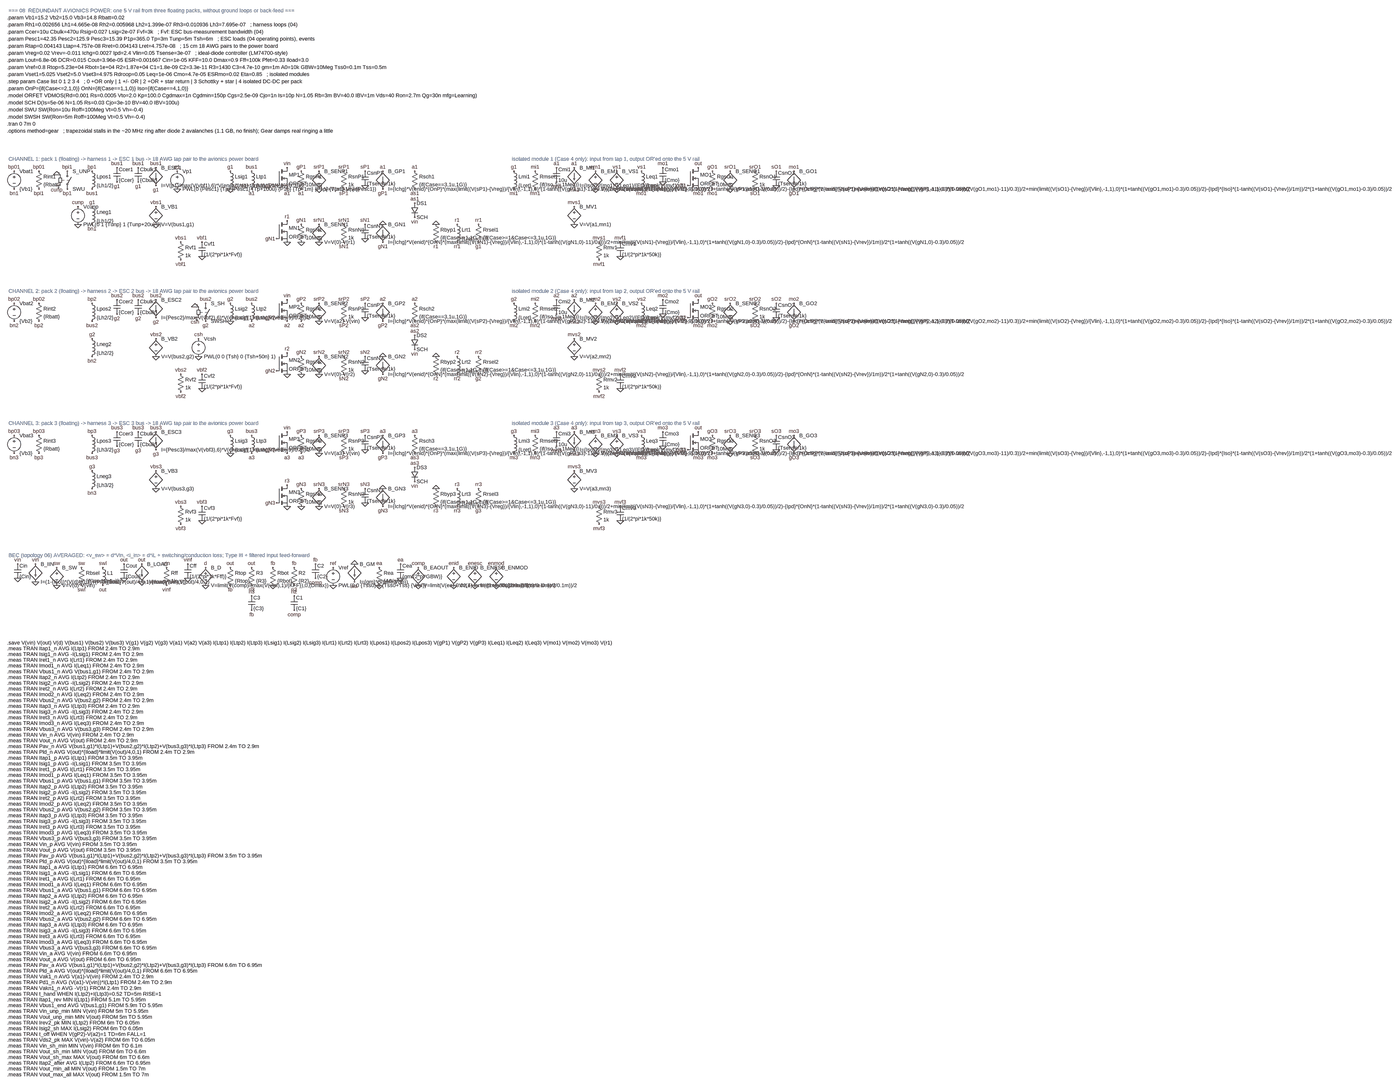
[diagram p0: schematic Redundant_Avionics.asc, whole sheet]
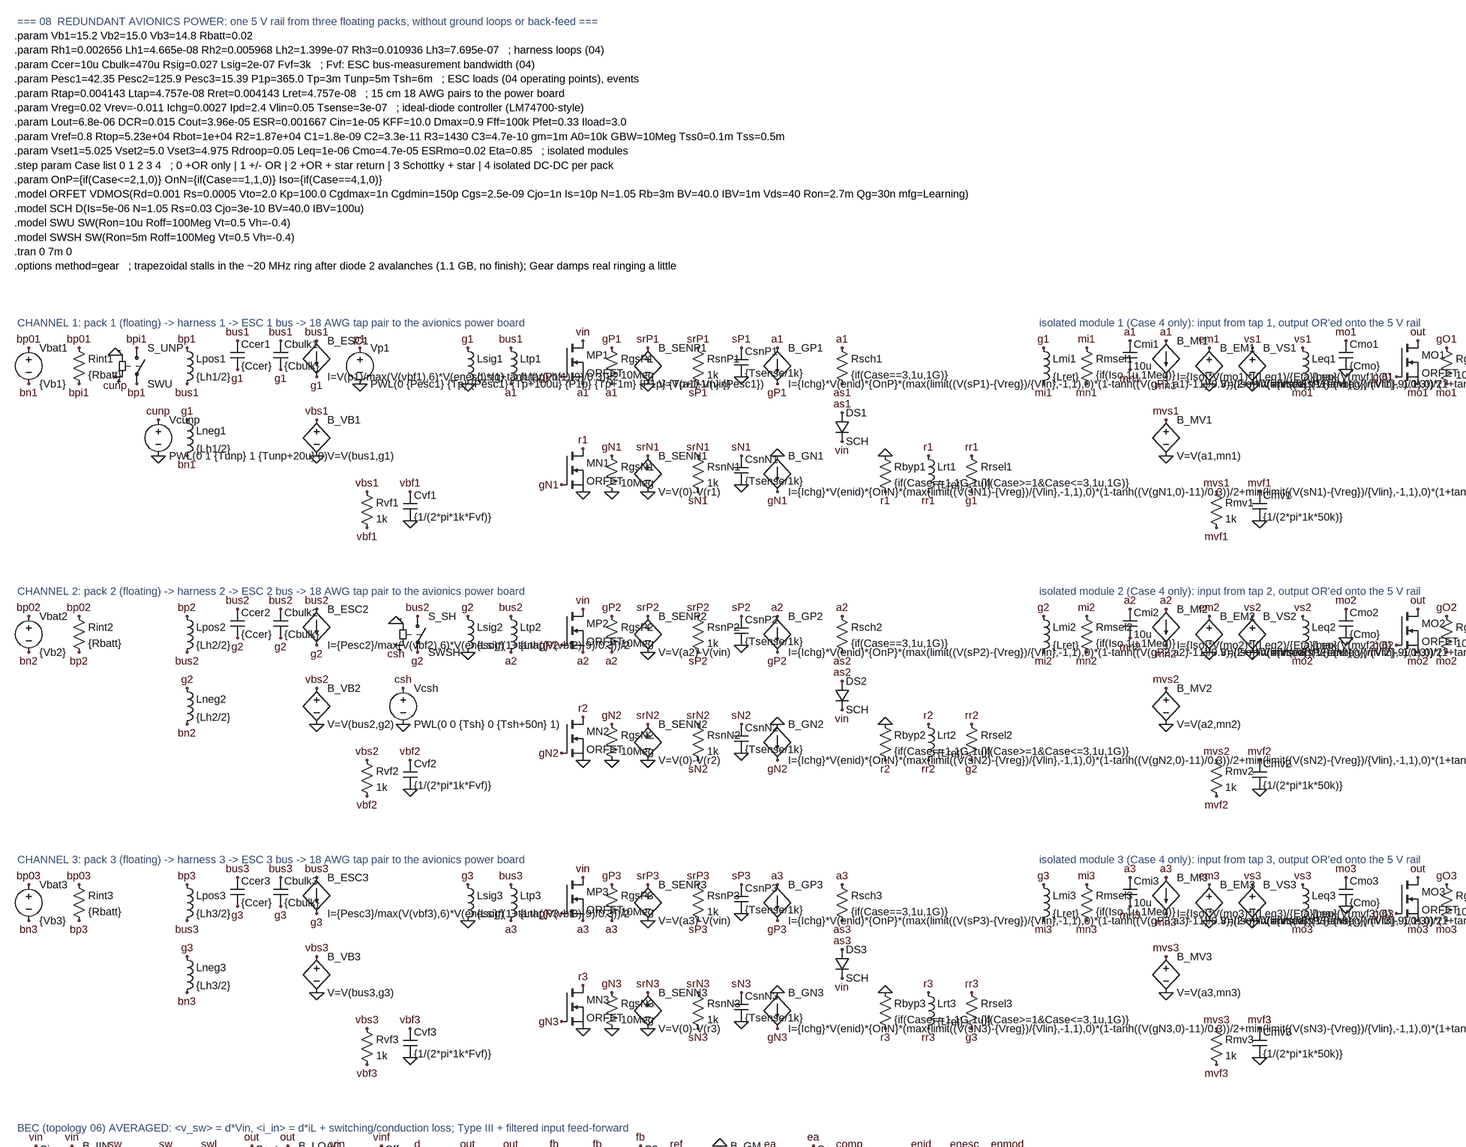
[diagram p1: schematic Redundant_Avionics.asc, part, row 1 of 2, column 1 of 2]
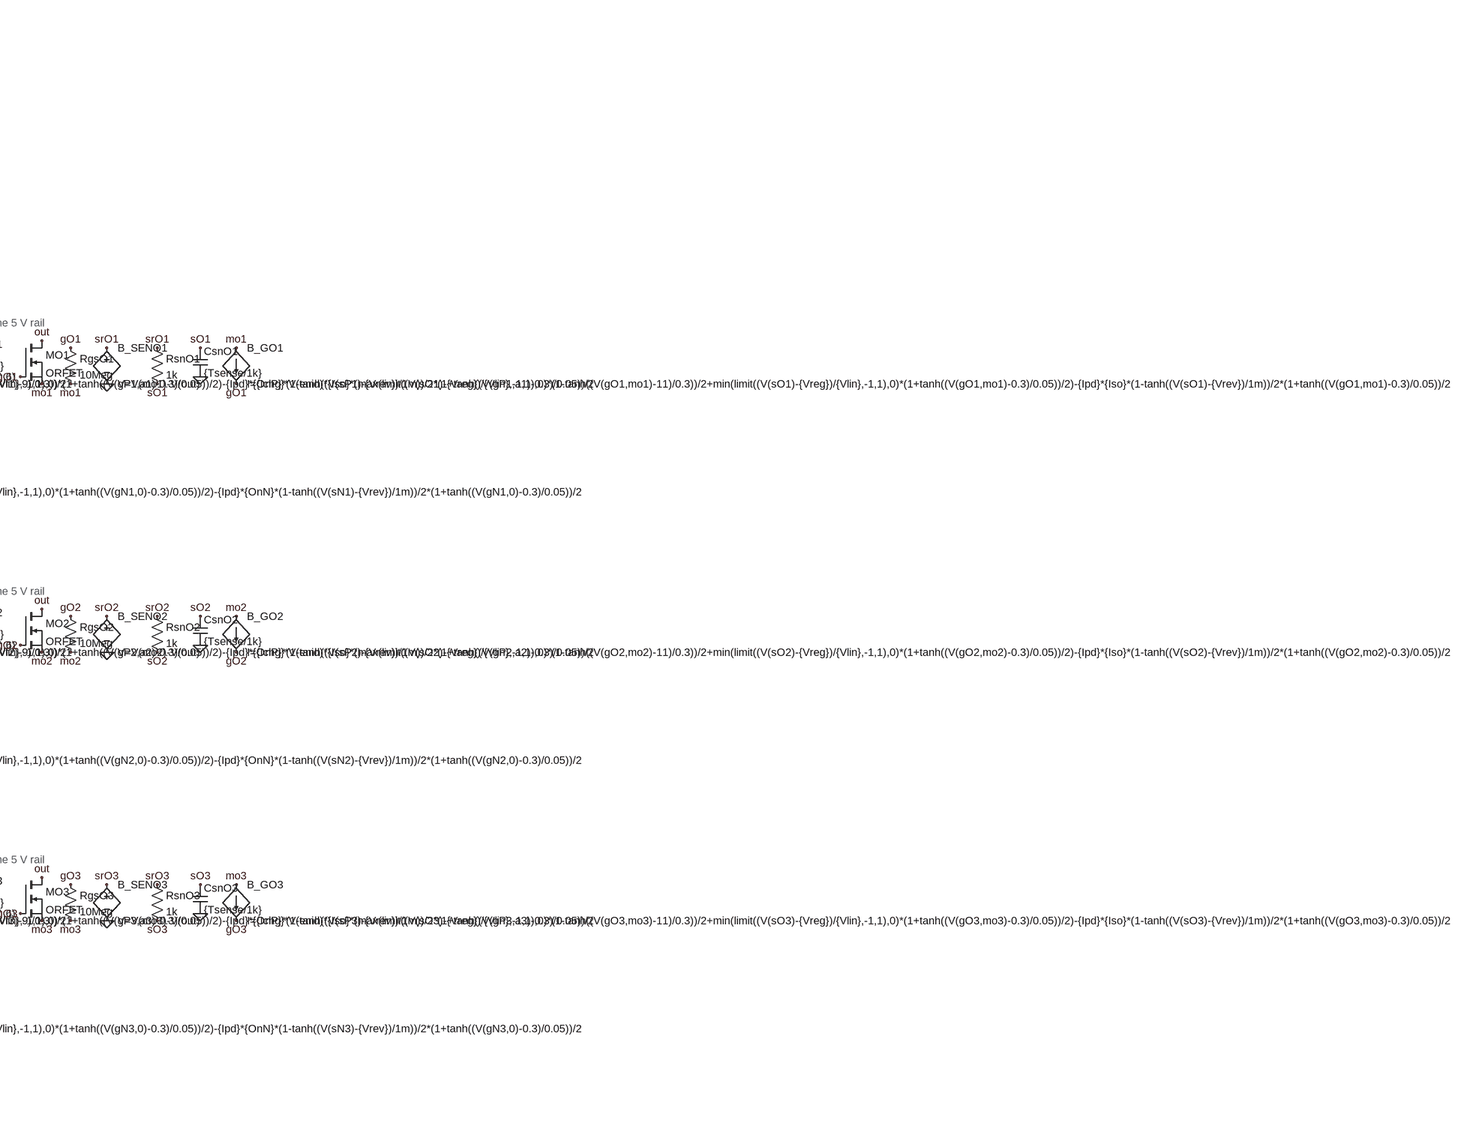
[diagram p2: schematic Redundant_Avionics.asc, part, row 1 of 2, column 2 of 2]
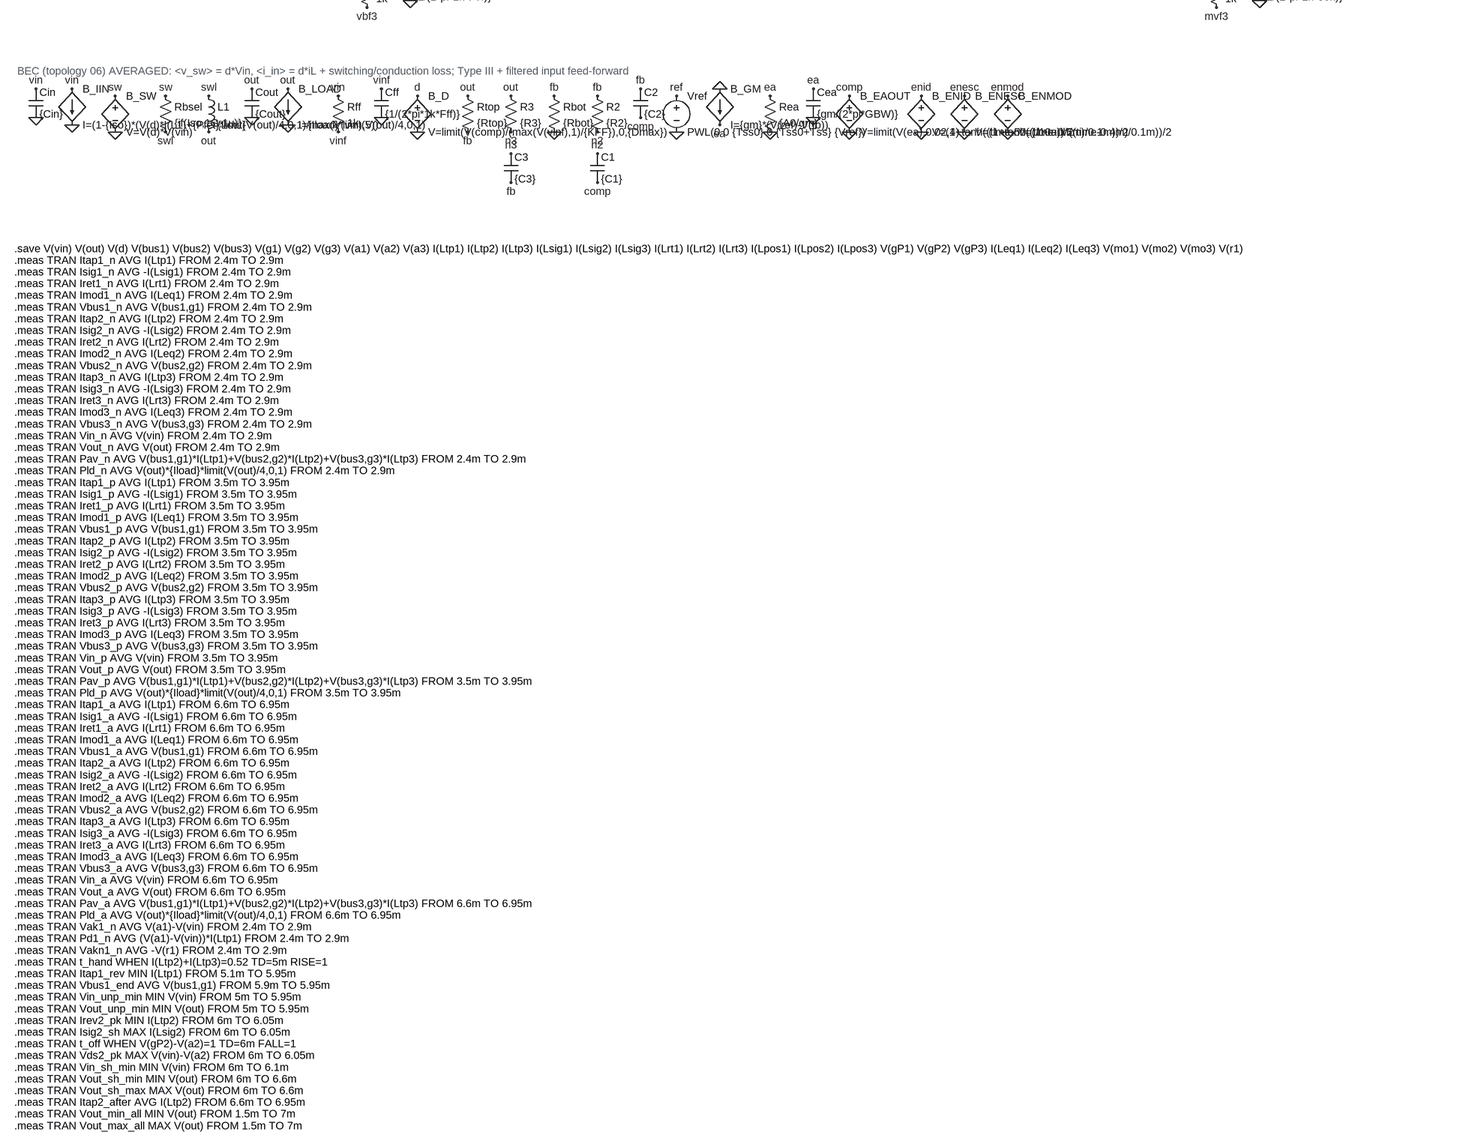
[diagram p3: schematic Redundant_Avionics.asc, part, row 2 of 2, column 1 of 2]
Redundant_Avionics.asc, the LTspice schematic file:
Version 4
SHEET 1 4200 3000
TEXT 32 -40 Left 2 ; CHANNEL 1: pack 1 (floating) -> harness 1 -> ESC 1 bus -> 18 AWG tap pair to the avionics power board
SYMBOL voltage 64 0 R0
SYMATTR InstName Vbat1
SYMATTR Value {Vb1}
FLAG 64 16 bp01
FLAG 64 96 bn1
SYMBOL res 160 0 R0
SYMATTR InstName Rint1
SYMATTR Value {Rbatt}
FLAG 176 16 bp01
FLAG 176 96 bpi1
SYMBOL sw 304 0 R0
SYMATTR InstName S_UNP
SYMATTR Value SWU
FLAG 304 16 bpi1
FLAG 304 96 bp1
FLAG 256 80 cunp
FLAG 256 32 0
SYMBOL voltage 352 160 R0
SYMATTR InstName Vcunp
SYMATTR Value PWL(0 1 {Tunp} 1 {Tunp+20u} 0)
FLAG 352 176 cunp
FLAG 352 256 0
SYMBOL ind 400 0 R0
SYMATTR InstName Lpos1
SYMATTR Value {Lh1/2}
SYMATTR SpiceLine Rser={Rh1/2}
FLAG 416 16 bp1
FLAG 416 96 bus1
SYMBOL ind 400 160 R0
SYMATTR InstName Lneg1
SYMATTR Value {Lh1/2}
SYMATTR SpiceLine Rser={Rh1/2}
FLAG 416 176 g1
FLAG 416 256 bn1
SYMBOL cap 512 0 R0
SYMATTR InstName Ccer1
SYMATTR Value {Ccer}
SYMATTR SpiceLine Rser=2m Lser=2n
FLAG 528 0 bus1
FLAG 528 64 g1
SYMBOL cap 608 0 R0
SYMATTR InstName Cbulk1
SYMATTR Value {Cbulk}
SYMATTR SpiceLine Rser=30m Lser=10n
FLAG 624 0 bus1
FLAG 624 64 g1
SYMBOL bi 704 0 R0
SYMATTR InstName B_ESC1
SYMATTR Value I=V(p1)/max(V(vbf1),6)*V(enesc)*(1+tanh((V(vbf1)-9)/0.3))/2
FLAG 704 0 bus1
FLAG 704 80 g1
SYMBOL bv 704 160 R0
SYMATTR InstName B_VB1
SYMATTR Value V=V(bus1,g1)
FLAG 704 176 vbs1
FLAG 704 256 0
SYMBOL res 800 320 R0
SYMATTR InstName Rvf1
SYMATTR Value 1k
FLAG 816 336 vbs1
FLAG 816 416 vbf1
SYMBOL cap 896 336 R0
SYMATTR InstName Cvf1
SYMATTR Value {1/(2*pi*1k*Fvf)}
FLAG 912 336 vbf1
FLAG 912 400 0
SYMBOL voltage 800 0 R0
SYMATTR InstName Vp1
SYMATTR Value PWL(0 {Pesc1} {Tp} {Pesc1} {Tp+100u} {P1p} {Tp+1m} {P1p} {Tp+1.1m} {Pesc1})
FLAG 800 16 p1
FLAG 800 96 0
SYMBOL ind 1024 0 R0
SYMATTR InstName Lsig1
SYMATTR Value {Lsig}
SYMATTR SpiceLine Rser={Rsig}
FLAG 1040 16 g1
FLAG 1040 96 0
SYMBOL ind 1120 0 R0
SYMATTR InstName Ltp1
SYMATTR Value {Ltap}
SYMATTR SpiceLine Rser={Rtap}
FLAG 1136 16 bus1
FLAG 1136 96 a1
SYMBOL nmos 1248 0 R0
SYMATTR InstName MP1
SYMATTR Value ORFET
FLAG 1296 0 vin
FLAG 1248 80 gP1
FLAG 1296 96 a1
SYMBOL res 1344 0 R0
SYMATTR InstName RgsP1
SYMATTR Value 10Meg
FLAG 1360 16 gP1
FLAG 1360 96 a1
SYMBOL bv 1440 0 R0
SYMATTR InstName B_SENP1
SYMATTR Value V=V(a1)-V(vin)
FLAG 1440 16 srP1
FLAG 1440 96 0
SYMBOL res 1536 0 R0
SYMATTR InstName RsnP1
SYMATTR Value 1k
FLAG 1552 16 srP1
FLAG 1552 96 sP1
SYMBOL cap 1632 16 R0
SYMATTR InstName CsnP1
SYMATTR Value {Tsense/1k}
FLAG 1648 16 sP1
FLAG 1648 80 0
SYMBOL bi 1728 16 R0
SYMATTR InstName B_GP1
SYMATTR Value I={Ichg}*V(enid)*{OnP}*(max(limit((V(sP1)-{Vreg})/{Vlin},-1,1),0)*(1-tanh((V(gP1,a1)-11)/0.3))/2+min(limit((V(sP1)-{Vreg})/{Vlin},-1,1),0)*(1+tanh((V(gP1,a1)-0.3)/0.05))/2)-{Ipd}*{OnP}*(1-tanh((V(sP1)-{Vrev})/1m))/2*(1+tanh((V(gP1,a1)-0.3)/0.05))/2
FLAG 1728 16 a1
FLAG 1728 96 gP1
SYMBOL res 1856 0 R0
SYMATTR InstName Rsch1
SYMATTR Value {if(Case==3,1u,1G)}
FLAG 1872 16 a1
FLAG 1872 96 as1
SYMBOL diode 1856 160 R0
SYMATTR InstName DS1
SYMATTR Value SCH
FLAG 1872 160 as1
FLAG 1872 224 vin
SYMBOL nmos 1248 240 R0
SYMATTR InstName MN1
SYMATTR Value ORFET
FLAG 1296 240 r1
FLAG 1248 320 gN1
FLAG 1296 336 0
SYMBOL res 1344 240 R0
SYMATTR InstName RgsN1
SYMATTR Value 10Meg
FLAG 1360 256 gN1
FLAG 1360 336 0
SYMBOL bv 1440 240 R0
SYMATTR InstName B_SENN1
SYMATTR Value V=V(0)-V(r1)
FLAG 1440 256 srN1
FLAG 1440 336 0
SYMBOL res 1536 240 R0
SYMATTR InstName RsnN1
SYMATTR Value 1k
FLAG 1552 256 srN1
FLAG 1552 336 sN1
SYMBOL cap 1632 256 R0
SYMATTR InstName CsnN1
SYMATTR Value {Tsense/1k}
FLAG 1648 256 sN1
FLAG 1648 320 0
SYMBOL bi 1728 256 R0
SYMATTR InstName B_GN1
SYMATTR Value I={Ichg}*V(enid)*{OnN}*(max(limit((V(sN1)-{Vreg})/{Vlin},-1,1),0)*(1-tanh((V(gN1,0)-11)/0.3))/2+min(limit((V(sN1)-{Vreg})/{Vlin},-1,1),0)*(1+tanh((V(gN1,0)-0.3)/0.05))/2)-{Ipd}*{OnN}*(1-tanh((V(sN1)-{Vrev})/1m))/2*(1+tanh((V(gN1,0)-0.3)/0.05))/2
FLAG 1728 256 0
FLAG 1728 336 gN1
SYMBOL res 1952 240 R0
SYMATTR InstName Rbyp1
SYMATTR Value {if(Case==1,1G,1u)}
FLAG 1968 256 0
FLAG 1968 336 r1
SYMBOL ind 2048 240 R0
SYMATTR InstName Lrt1
SYMATTR Value {Lret}
SYMATTR SpiceLine Rser={Rret}
FLAG 2064 256 r1
FLAG 2064 336 rr1
SYMBOL res 2144 240 R0
SYMATTR InstName Rrsel1
SYMATTR Value {if(Case>=1&Case<=3,1u,1G)}
FLAG 2160 256 rr1
FLAG 2160 336 g1
TEXT 2304 -40 Left 2 ; isolated module 1 (Case 4 only): input from tap 1, output OR'ed onto the 5 V rail
SYMBOL ind 2304 0 R0
SYMATTR InstName Lmi1
SYMATTR Value {Lret}
SYMATTR SpiceLine Rser={Rret}
FLAG 2320 16 g1
FLAG 2320 96 mi1
SYMBOL res 2400 0 R0
SYMATTR InstName Rmsel1
SYMATTR Value {if(Iso,1u,1Meg)}
FLAG 2416 16 mi1
FLAG 2416 96 mn1
SYMBOL cap 2496 0 R0
SYMATTR InstName Cmi1
SYMATTR Value 10u
SYMATTR SpiceLine Rser=5m
FLAG 2512 0 a1
FLAG 2512 64 mn1
SYMBOL bi 2592 0 R0
SYMATTR InstName B_MI1
SYMATTR Value I={Iso}*V(mo1)*I(Leq1)/{Eta}/max(V(mvf1),6)
FLAG 2592 0 a1
FLAG 2592 80 mn1
SYMBOL bv 2592 160 R0
SYMATTR InstName B_MV1
SYMATTR Value V=V(a1,mn1)
FLAG 2592 176 mvs1
FLAG 2592 256 0
SYMBOL res 2688 320 R0
SYMATTR InstName Rmv1
SYMATTR Value 1k
FLAG 2704 336 mvs1
FLAG 2704 416 mvf1
SYMBOL cap 2784 336 R0
SYMATTR InstName Cmv1
SYMATTR Value {1/(2*pi*1k*50k)}
FLAG 2800 336 mvf1
FLAG 2800 400 0
SYMBOL bv 2688 0 R0
SYMATTR InstName B_EM1
SYMATTR Value V={Iso}*V(enmod)*(1+tanh((V(mvf1)-9)/0.3))/2
FLAG 2688 16 em1
FLAG 2688 96 0
SYMBOL bv 2784 0 R0
SYMATTR InstName B_VS1
SYMATTR Value V={Vset1}*V(em1)
FLAG 2784 16 vs1
FLAG 2784 96 0
SYMBOL ind 2880 0 R0
SYMATTR InstName Leq1
SYMATTR Value {Leq}
SYMATTR SpiceLine Rser={Rdroop}
FLAG 2896 16 vs1
FLAG 2896 96 mo1
SYMBOL cap 2976 0 R0
SYMATTR InstName Cmo1
SYMATTR Value {Cmo}
SYMATTR SpiceLine Rser={ESRmo}
FLAG 2992 0 mo1
FLAG 2992 64 0
SYMBOL nmos 3104 0 R0
SYMATTR InstName MO1
SYMATTR Value ORFET
FLAG 3152 0 out
FLAG 3104 80 gO1
FLAG 3152 96 mo1
SYMBOL res 3200 0 R0
SYMATTR InstName RgsO1
SYMATTR Value 10Meg
FLAG 3216 16 gO1
FLAG 3216 96 mo1
SYMBOL bv 3296 0 R0
SYMATTR InstName B_SENO1
SYMATTR Value V=V(mo1)-V(out)
FLAG 3296 16 srO1
FLAG 3296 96 0
SYMBOL res 3392 0 R0
SYMATTR InstName RsnO1
SYMATTR Value 1k
FLAG 3408 16 srO1
FLAG 3408 96 sO1
SYMBOL cap 3488 16 R0
SYMATTR InstName CsnO1
SYMATTR Value {Tsense/1k}
FLAG 3504 16 sO1
FLAG 3504 80 0
SYMBOL bi 3584 16 R0
SYMATTR InstName B_GO1
SYMATTR Value I={Ichg}*V(enid)*{Iso}*(max(limit((V(sO1)-{Vreg})/{Vlin},-1,1),0)*(1-tanh((V(gO1,mo1)-11)/0.3))/2+min(limit((V(sO1)-{Vreg})/{Vlin},-1,1),0)*(1+tanh((V(gO1,mo1)-0.3)/0.05))/2)-{Ipd}*{Iso}*(1-tanh((V(sO1)-{Vrev})/1m))/2*(1+tanh((V(gO1,mo1)-0.3)/0.05))/2
FLAG 3584 16 mo1
FLAG 3584 96 gO1
TEXT 32 680 Left 2 ; CHANNEL 2: pack 2 (floating) -> harness 2 -> ESC 2 bus -> 18 AWG tap pair to the avionics power board
SYMBOL voltage 64 720 R0
SYMATTR InstName Vbat2
SYMATTR Value {Vb2}
FLAG 64 736 bp02
FLAG 64 816 bn2
SYMBOL res 160 720 R0
SYMATTR InstName Rint2
SYMATTR Value {Rbatt}
FLAG 176 736 bp02
FLAG 176 816 bp2
SYMBOL ind 400 720 R0
SYMATTR InstName Lpos2
SYMATTR Value {Lh2/2}
SYMATTR SpiceLine Rser={Rh2/2}
FLAG 416 736 bp2
FLAG 416 816 bus2
SYMBOL ind 400 880 R0
SYMATTR InstName Lneg2
SYMATTR Value {Lh2/2}
SYMATTR SpiceLine Rser={Rh2/2}
FLAG 416 896 g2
FLAG 416 976 bn2
SYMBOL cap 512 720 R0
SYMATTR InstName Ccer2
SYMATTR Value {Ccer}
SYMATTR SpiceLine Rser=2m Lser=2n
FLAG 528 720 bus2
FLAG 528 784 g2
SYMBOL cap 608 720 R0
SYMATTR InstName Cbulk2
SYMATTR Value {Cbulk}
SYMATTR SpiceLine Rser=30m Lser=10n
FLAG 624 720 bus2
FLAG 624 784 g2
SYMBOL bi 704 720 R0
SYMATTR InstName B_ESC2
SYMATTR Value I={Pesc2}/max(V(vbf2),6)*V(enesc)*(1+tanh((V(vbf2)-9)/0.3))/2
FLAG 704 720 bus2
FLAG 704 800 g2
SYMBOL bv 704 880 R0
SYMATTR InstName B_VB2
SYMATTR Value V=V(bus2,g2)
FLAG 704 896 vbs2
FLAG 704 976 0
SYMBOL res 800 1040 R0
SYMATTR InstName Rvf2
SYMATTR Value 1k
FLAG 816 1056 vbs2
FLAG 816 1136 vbf2
SYMBOL cap 896 1056 R0
SYMATTR InstName Cvf2
SYMATTR Value {1/(2*pi*1k*Fvf)}
FLAG 912 1056 vbf2
FLAG 912 1120 0
SYMBOL sw 928 720 R0
SYMATTR InstName S_SH
SYMATTR Value SWSH
FLAG 928 736 bus2
FLAG 928 816 g2
FLAG 880 800 csh
FLAG 880 752 0
SYMBOL voltage 896 880 R0
SYMATTR InstName Vcsh
SYMATTR Value PWL(0 0 {Tsh} 0 {Tsh+50n} 1)
FLAG 896 896 csh
FLAG 896 976 0
SYMBOL ind 1024 720 R0
SYMATTR InstName Lsig2
SYMATTR Value {Lsig}
SYMATTR SpiceLine Rser={Rsig}
FLAG 1040 736 g2
FLAG 1040 816 0
SYMBOL ind 1120 720 R0
SYMATTR InstName Ltp2
SYMATTR Value {Ltap}
SYMATTR SpiceLine Rser={Rtap}
FLAG 1136 736 bus2
FLAG 1136 816 a2
SYMBOL nmos 1248 720 R0
SYMATTR InstName MP2
SYMATTR Value ORFET
FLAG 1296 720 vin
FLAG 1248 800 gP2
FLAG 1296 816 a2
SYMBOL res 1344 720 R0
SYMATTR InstName RgsP2
SYMATTR Value 10Meg
FLAG 1360 736 gP2
FLAG 1360 816 a2
SYMBOL bv 1440 720 R0
SYMATTR InstName B_SENP2
SYMATTR Value V=V(a2)-V(vin)
FLAG 1440 736 srP2
FLAG 1440 816 0
SYMBOL res 1536 720 R0
SYMATTR InstName RsnP2
SYMATTR Value 1k
FLAG 1552 736 srP2
FLAG 1552 816 sP2
SYMBOL cap 1632 736 R0
SYMATTR InstName CsnP2
SYMATTR Value {Tsense/1k}
FLAG 1648 736 sP2
FLAG 1648 800 0
SYMBOL bi 1728 736 R0
SYMATTR InstName B_GP2
SYMATTR Value I={Ichg}*V(enid)*{OnP}*(max(limit((V(sP2)-{Vreg})/{Vlin},-1,1),0)*(1-tanh((V(gP2,a2)-11)/0.3))/2+min(limit((V(sP2)-{Vreg})/{Vlin},-1,1),0)*(1+tanh((V(gP2,a2)-0.3)/0.05))/2)-{Ipd}*{OnP}*(1-tanh((V(sP2)-{Vrev})/1m))/2*(1+tanh((V(gP2,a2)-0.3)/0.05))/2
FLAG 1728 736 a2
FLAG 1728 816 gP2
SYMBOL res 1856 720 R0
SYMATTR InstName Rsch2
SYMATTR Value {if(Case==3,1u,1G)}
FLAG 1872 736 a2
FLAG 1872 816 as2
SYMBOL diode 1856 880 R0
SYMATTR InstName DS2
SYMATTR Value SCH
FLAG 1872 880 as2
FLAG 1872 944 vin
SYMBOL nmos 1248 960 R0
SYMATTR InstName MN2
SYMATTR Value ORFET
FLAG 1296 960 r2
FLAG 1248 1040 gN2
FLAG 1296 1056 0
SYMBOL res 1344 960 R0
SYMATTR InstName RgsN2
SYMATTR Value 10Meg
FLAG 1360 976 gN2
FLAG 1360 1056 0
SYMBOL bv 1440 960 R0
SYMATTR InstName B_SENN2
SYMATTR Value V=V(0)-V(r2)
FLAG 1440 976 srN2
FLAG 1440 1056 0
SYMBOL res 1536 960 R0
SYMATTR InstName RsnN2
SYMATTR Value 1k
FLAG 1552 976 srN2
FLAG 1552 1056 sN2
SYMBOL cap 1632 976 R0
SYMATTR InstName CsnN2
SYMATTR Value {Tsense/1k}
FLAG 1648 976 sN2
FLAG 1648 1040 0
SYMBOL bi 1728 976 R0
SYMATTR InstName B_GN2
SYMATTR Value I={Ichg}*V(enid)*{OnN}*(max(limit((V(sN2)-{Vreg})/{Vlin},-1,1),0)*(1-tanh((V(gN2,0)-11)/0.3))/2+min(limit((V(sN2)-{Vreg})/{Vlin},-1,1),0)*(1+tanh((V(gN2,0)-0.3)/0.05))/2)-{Ipd}*{OnN}*(1-tanh((V(sN2)-{Vrev})/1m))/2*(1+tanh((V(gN2,0)-0.3)/0.05))/2
FLAG 1728 976 0
FLAG 1728 1056 gN2
SYMBOL res 1952 960 R0
SYMATTR InstName Rbyp2
SYMATTR Value {if(Case==1,1G,1u)}
FLAG 1968 976 0
FLAG 1968 1056 r2
SYMBOL ind 2048 960 R0
SYMATTR InstName Lrt2
SYMATTR Value {Lret}
SYMATTR SpiceLine Rser={Rret}
FLAG 2064 976 r2
FLAG 2064 1056 rr2
SYMBOL res 2144 960 R0
SYMATTR InstName Rrsel2
SYMATTR Value {if(Case>=1&Case<=3,1u,1G)}
FLAG 2160 976 rr2
FLAG 2160 1056 g2
TEXT 2304 680 Left 2 ; isolated module 2 (Case 4 only): input from tap 2, output OR'ed onto the 5 V rail
SYMBOL ind 2304 720 R0
SYMATTR InstName Lmi2
SYMATTR Value {Lret}
SYMATTR SpiceLine Rser={Rret}
FLAG 2320 736 g2
FLAG 2320 816 mi2
SYMBOL res 2400 720 R0
SYMATTR InstName Rmsel2
SYMATTR Value {if(Iso,1u,1Meg)}
FLAG 2416 736 mi2
FLAG 2416 816 mn2
SYMBOL cap 2496 720 R0
SYMATTR InstName Cmi2
SYMATTR Value 10u
SYMATTR SpiceLine Rser=5m
FLAG 2512 720 a2
FLAG 2512 784 mn2
SYMBOL bi 2592 720 R0
SYMATTR InstName B_MI2
SYMATTR Value I={Iso}*V(mo2)*I(Leq2)/{Eta}/max(V(mvf2),6)
FLAG 2592 720 a2
FLAG 2592 800 mn2
SYMBOL bv 2592 880 R0
SYMATTR InstName B_MV2
SYMATTR Value V=V(a2,mn2)
FLAG 2592 896 mvs2
FLAG 2592 976 0
SYMBOL res 2688 1040 R0
SYMATTR InstName Rmv2
SYMATTR Value 1k
FLAG 2704 1056 mvs2
FLAG 2704 1136 mvf2
SYMBOL cap 2784 1056 R0
SYMATTR InstName Cmv2
SYMATTR Value {1/(2*pi*1k*50k)}
FLAG 2800 1056 mvf2
FLAG 2800 1120 0
SYMBOL bv 2688 720 R0
SYMATTR InstName B_EM2
SYMATTR Value V={Iso}*V(enmod)*(1+tanh((V(mvf2)-9)/0.3))/2
FLAG 2688 736 em2
FLAG 2688 816 0
SYMBOL bv 2784 720 R0
SYMATTR InstName B_VS2
SYMATTR Value V={Vset2}*V(em2)
FLAG 2784 736 vs2
FLAG 2784 816 0
SYMBOL ind 2880 720 R0
SYMATTR InstName Leq2
SYMATTR Value {Leq}
SYMATTR SpiceLine Rser={Rdroop}
FLAG 2896 736 vs2
FLAG 2896 816 mo2
SYMBOL cap 2976 720 R0
SYMATTR InstName Cmo2
SYMATTR Value {Cmo}
SYMATTR SpiceLine Rser={ESRmo}
FLAG 2992 720 mo2
FLAG 2992 784 0
SYMBOL nmos 3104 720 R0
SYMATTR InstName MO2
SYMATTR Value ORFET
FLAG 3152 720 out
FLAG 3104 800 gO2
FLAG 3152 816 mo2
SYMBOL res 3200 720 R0
SYMATTR InstName RgsO2
SYMATTR Value 10Meg
FLAG 3216 736 gO2
FLAG 3216 816 mo2
SYMBOL bv 3296 720 R0
SYMATTR InstName B_SENO2
SYMATTR Value V=V(mo2)-V(out)
FLAG 3296 736 srO2
FLAG 3296 816 0
SYMBOL res 3392 720 R0
SYMATTR InstName RsnO2
SYMATTR Value 1k
FLAG 3408 736 srO2
FLAG 3408 816 sO2
SYMBOL cap 3488 736 R0
SYMATTR InstName CsnO2
SYMATTR Value {Tsense/1k}
FLAG 3504 736 sO2
FLAG 3504 800 0
SYMBOL bi 3584 736 R0
SYMATTR InstName B_GO2
SYMATTR Value I={Ichg}*V(enid)*{Iso}*(max(limit((V(sO2)-{Vreg})/{Vlin},-1,1),0)*(1-tanh((V(gO2,mo2)-11)/0.3))/2+min(limit((V(sO2)-{Vreg})/{Vlin},-1,1),0)*(1+tanh((V(gO2,mo2)-0.3)/0.05))/2)-{Ipd}*{Iso}*(1-tanh((V(sO2)-{Vrev})/1m))/2*(1+tanh((V(gO2,mo2)-0.3)/0.05))/2
FLAG 3584 736 mo2
FLAG 3584 816 gO2
TEXT 32 1400 Left 2 ; CHANNEL 3: pack 3 (floating) -> harness 3 -> ESC 3 bus -> 18 AWG tap pair to the avionics power board
SYMBOL voltage 64 1440 R0
SYMATTR InstName Vbat3
SYMATTR Value {Vb3}
FLAG 64 1456 bp03
FLAG 64 1536 bn3
SYMBOL res 160 1440 R0
SYMATTR InstName Rint3
SYMATTR Value {Rbatt}
FLAG 176 1456 bp03
FLAG 176 1536 bp3
SYMBOL ind 400 1440 R0
SYMATTR InstName Lpos3
SYMATTR Value {Lh3/2}
SYMATTR SpiceLine Rser={Rh3/2}
FLAG 416 1456 bp3
FLAG 416 1536 bus3
SYMBOL ind 400 1600 R0
SYMATTR InstName Lneg3
SYMATTR Value {Lh3/2}
SYMATTR SpiceLine Rser={Rh3/2}
FLAG 416 1616 g3
FLAG 416 1696 bn3
SYMBOL cap 512 1440 R0
SYMATTR InstName Ccer3
SYMATTR Value {Ccer}
SYMATTR SpiceLine Rser=2m Lser=2n
FLAG 528 1440 bus3
FLAG 528 1504 g3
SYMBOL cap 608 1440 R0
SYMATTR InstName Cbulk3
SYMATTR Value {Cbulk}
SYMATTR SpiceLine Rser=30m Lser=10n
FLAG 624 1440 bus3
FLAG 624 1504 g3
SYMBOL bi 704 1440 R0
SYMATTR InstName B_ESC3
SYMATTR Value I={Pesc3}/max(V(vbf3),6)*V(enesc)*(1+tanh((V(vbf3)-9)/0.3))/2
FLAG 704 1440 bus3
FLAG 704 1520 g3
SYMBOL bv 704 1600 R0
SYMATTR InstName B_VB3
SYMATTR Value V=V(bus3,g3)
FLAG 704 1616 vbs3
FLAG 704 1696 0
SYMBOL res 800 1760 R0
SYMATTR InstName Rvf3
SYMATTR Value 1k
FLAG 816 1776 vbs3
FLAG 816 1856 vbf3
SYMBOL cap 896 1776 R0
SYMATTR InstName Cvf3
SYMATTR Value {1/(2*pi*1k*Fvf)}
FLAG 912 1776 vbf3
FLAG 912 1840 0
SYMBOL ind 1024 1440 R0
SYMATTR InstName Lsig3
SYMATTR Value {Lsig}
SYMATTR SpiceLine Rser={Rsig}
FLAG 1040 1456 g3
FLAG 1040 1536 0
SYMBOL ind 1120 1440 R0
SYMATTR InstName Ltp3
SYMATTR Value {Ltap}
SYMATTR SpiceLine Rser={Rtap}
FLAG 1136 1456 bus3
FLAG 1136 1536 a3
SYMBOL nmos 1248 1440 R0
SYMATTR InstName MP3
SYMATTR Value ORFET
FLAG 1296 1440 vin
FLAG 1248 1520 gP3
FLAG 1296 1536 a3
SYMBOL res 1344 1440 R0
SYMATTR InstName RgsP3
SYMATTR Value 10Meg
FLAG 1360 1456 gP3
FLAG 1360 1536 a3
SYMBOL bv 1440 1440 R0
SYMATTR InstName B_SENP3
SYMATTR Value V=V(a3)-V(vin)
FLAG 1440 1456 srP3
FLAG 1440 1536 0
SYMBOL res 1536 1440 R0
SYMATTR InstName RsnP3
SYMATTR Value 1k
FLAG 1552 1456 srP3
FLAG 1552 1536 sP3
SYMBOL cap 1632 1456 R0
SYMATTR InstName CsnP3
SYMATTR Value {Tsense/1k}
FLAG 1648 1456 sP3
FLAG 1648 1520 0
SYMBOL bi 1728 1456 R0
SYMATTR InstName B_GP3
SYMATTR Value I={Ichg}*V(enid)*{OnP}*(max(limit((V(sP3)-{Vreg})/{Vlin},-1,1),0)*(1-tanh((V(gP3,a3)-11)/0.3))/2+min(limit((V(sP3)-{Vreg})/{Vlin},-1,1),0)*(1+tanh((V(gP3,a3)-0.3)/0.05))/2)-{Ipd}*{OnP}*(1-tanh((V(sP3)-{Vrev})/1m))/2*(1+tanh((V(gP3,a3)-0.3)/0.05))/2
FLAG 1728 1456 a3
FLAG 1728 1536 gP3
SYMBOL res 1856 1440 R0
SYMATTR InstName Rsch3
SYMATTR Value {if(Case==3,1u,1G)}
FLAG 1872 1456 a3
FLAG 1872 1536 as3
SYMBOL diode 1856 1600 R0
SYMATTR InstName DS3
SYMATTR Value SCH
FLAG 1872 1600 as3
FLAG 1872 1664 vin
SYMBOL nmos 1248 1680 R0
SYMATTR InstName MN3
SYMATTR Value ORFET
FLAG 1296 1680 r3
FLAG 1248 1760 gN3
FLAG 1296 1776 0
SYMBOL res 1344 1680 R0
SYMATTR InstName RgsN3
SYMATTR Value 10Meg
FLAG 1360 1696 gN3
FLAG 1360 1776 0
SYMBOL bv 1440 1680 R0
SYMATTR InstName B_SENN3
SYMATTR Value V=V(0)-V(r3)
FLAG 1440 1696 srN3
FLAG 1440 1776 0
SYMBOL res 1536 1680 R0
SYMATTR InstName RsnN3
SYMATTR Value 1k
FLAG 1552 1696 srN3
FLAG 1552 1776 sN3
SYMBOL cap 1632 1696 R0
SYMATTR InstName CsnN3
SYMATTR Value {Tsense/1k}
FLAG 1648 1696 sN3
FLAG 1648 1760 0
SYMBOL bi 1728 1696 R0
SYMATTR InstName B_GN3
SYMATTR Value I={Ichg}*V(enid)*{OnN}*(max(limit((V(sN3)-{Vreg})/{Vlin},-1,1),0)*(1-tanh((V(gN3,0)-11)/0.3))/2+min(limit((V(sN3)-{Vreg})/{Vlin},-1,1),0)*(1+tanh((V(gN3,0)-0.3)/0.05))/2)-{Ipd}*{OnN}*(1-tanh((V(sN3)-{Vrev})/1m))/2*(1+tanh((V(gN3,0)-0.3)/0.05))/2
FLAG 1728 1696 0
FLAG 1728 1776 gN3
SYMBOL res 1952 1680 R0
SYMATTR InstName Rbyp3
SYMATTR Value {if(Case==1,1G,1u)}
FLAG 1968 1696 0
FLAG 1968 1776 r3
SYMBOL ind 2048 1680 R0
SYMATTR InstName Lrt3
SYMATTR Value {Lret}
SYMATTR SpiceLine Rser={Rret}
FLAG 2064 1696 r3
FLAG 2064 1776 rr3
SYMBOL res 2144 1680 R0
SYMATTR InstName Rrsel3
SYMATTR Value {if(Case>=1&Case<=3,1u,1G)}
FLAG 2160 1696 rr3
FLAG 2160 1776 g3
TEXT 2304 1400 Left 2 ; isolated module 3 (Case 4 only): input from tap 3, output OR'ed onto the 5 V rail
SYMBOL ind 2304 1440 R0
SYMATTR InstName Lmi3
SYMATTR Value {Lret}
SYMATTR SpiceLine Rser={Rret}
FLAG 2320 1456 g3
FLAG 2320 1536 mi3
SYMBOL res 2400 1440 R0
SYMATTR InstName Rmsel3
SYMATTR Value {if(Iso,1u,1Meg)}
FLAG 2416 1456 mi3
FLAG 2416 1536 mn3
SYMBOL cap 2496 1440 R0
SYMATTR InstName Cmi3
SYMATTR Value 10u
SYMATTR SpiceLine Rser=5m
FLAG 2512 1440 a3
FLAG 2512 1504 mn3
SYMBOL bi 2592 1440 R0
SYMATTR InstName B_MI3
SYMATTR Value I={Iso}*V(mo3)*I(Leq3)/{Eta}/max(V(mvf3),6)
FLAG 2592 1440 a3
FLAG 2592 1520 mn3
SYMBOL bv 2592 1600 R0
SYMATTR InstName B_MV3
SYMATTR Value V=V(a3,mn3)
FLAG 2592 1616 mvs3
FLAG 2592 1696 0
SYMBOL res 2688 1760 R0
SYMATTR InstName Rmv3
SYMATTR Value 1k
FLAG 2704 1776 mvs3
FLAG 2704 1856 mvf3
SYMBOL cap 2784 1776 R0
SYMATTR InstName Cmv3
SYMATTR Value {1/(2*pi*1k*50k)}
FLAG 2800 1776 mvf3
FLAG 2800 1840 0
SYMBOL bv 2688 1440 R0
SYMATTR InstName B_EM3
SYMATTR Value V={Iso}*V(enmod)*(1+tanh((V(mvf3)-9)/0.3))/2
FLAG 2688 1456 em3
FLAG 2688 1536 0
SYMBOL bv 2784 1440 R0
SYMATTR InstName B_VS3
SYMATTR Value V={Vset3}*V(em3)
FLAG 2784 1456 vs3
FLAG 2784 1536 0
SYMBOL ind 2880 1440 R0
SYMATTR InstName Leq3
SYMATTR Value {Leq}
SYMATTR SpiceLine Rser={Rdroop}
FLAG 2896 1456 vs3
FLAG 2896 1536 mo3
SYMBOL cap 2976 1440 R0
SYMATTR InstName Cmo3
SYMATTR Value {Cmo}
SYMATTR SpiceLine Rser={ESRmo}
FLAG 2992 1440 mo3
FLAG 2992 1504 0
SYMBOL nmos 3104 1440 R0
SYMATTR InstName MO3
SYMATTR Value ORFET
FLAG 3152 1440 out
FLAG 3104 1520 gO3
FLAG 3152 1536 mo3
SYMBOL res 3200 1440 R0
SYMATTR InstName RgsO3
SYMATTR Value 10Meg
FLAG 3216 1456 gO3
FLAG 3216 1536 mo3
SYMBOL bv 3296 1440 R0
SYMATTR InstName B_SENO3
SYMATTR Value V=V(mo3)-V(out)
FLAG 3296 1456 srO3
FLAG 3296 1536 0
SYMBOL res 3392 1440 R0
SYMATTR InstName RsnO3
SYMATTR Value 1k
FLAG 3408 1456 srO3
FLAG 3408 1536 sO3
SYMBOL cap 3488 1456 R0
SYMATTR InstName CsnO3
SYMATTR Value {Tsense/1k}
FLAG 3504 1456 sO3
FLAG 3504 1520 0
SYMBOL bi 3584 1456 R0
SYMATTR InstName B_GO3
SYMATTR Value I={Ichg}*V(enid)*{Iso}*(max(limit((V(sO3)-{Vreg})/{Vlin},-1,1),0)*(1-tanh((V(gO3,mo3)-11)/0.3))/2+min(limit((V(sO3)-{Vreg})/{Vlin},-1,1),0)*(1+tanh((V(gO3,mo3)-0.3)/0.05))/2)-{Ipd}*{Iso}*(1-tanh((V(sO3)-{Vrev})/1m))/2*(1+tanh((V(gO3,mo3)-0.3)/0.05))/2
FLAG 3584 1456 mo3
FLAG 3584 1536 gO3
TEXT 32 2160 Left 2 ; BEC (topology 06) AVERAGED: <v_sw> = d*Vin, <i_in> = d*iL + switching/conduction loss; Type III + filtered input feed-forward
SYMBOL cap 64 2200 R0
SYMATTR InstName Cin
SYMATTR Value {Cin}
SYMATTR SpiceLine Rser=3m Lser=0.5n
FLAG 80 2200 vin
FLAG 80 2264 0
SYMBOL bi 160 2200 R0
SYMATTR InstName B_IIN
SYMATTR Value I=(1-{Iso})*(V(d)*I(L1)+{Pfet}*limit(V(out)/4,0,1)/max(V(vin),5))
FLAG 160 2200 vin
FLAG 160 2280 0
SYMBOL bv 256 2200 R0
SYMATTR InstName B_SW
SYMATTR Value V=V(d)*V(vin)
FLAG 256 2216 sw
FLAG 256 2296 0
SYMBOL res 352 2200 R0
SYMATTR InstName Rbsel
SYMATTR Value {if(Iso,1G,1u)}
FLAG 368 2216 sw
FLAG 368 2296 swl
SYMBOL ind 448 2200 R0
SYMATTR InstName L1
SYMATTR Value {Lout}
SYMATTR SpiceLine Rser={DCR}
FLAG 464 2216 swl
FLAG 464 2296 out
SYMBOL cap 544 2200 R0
SYMATTR InstName Cout
SYMATTR Value {Cout}
SYMATTR SpiceLine Rser={ESR} Lser=0.3n
FLAG 560 2200 out
FLAG 560 2264 0
SYMBOL bi 640 2200 R0
SYMATTR InstName B_LOAD
SYMATTR Value I={Iload}*limit(V(out)/4,0,1)
FLAG 640 2200 out
FLAG 640 2280 0
SYMBOL res 736 2200 R0
SYMATTR InstName Rff
SYMATTR Value 1k
FLAG 752 2216 vin
FLAG 752 2296 vinf
SYMBOL cap 832 2200 R0
SYMATTR InstName Cff
SYMATTR Value {1/(2*pi*1k*Fff)}
FLAG 848 2200 vinf
FLAG 848 2264 0
SYMBOL bv 928 2200 R0
SYMATTR InstName B_D
SYMATTR Value V=limit(V(comp)/(max(V(vinf),1)/{KFF}),0,{Dmax})
FLAG 928 2216 d
FLAG 928 2296 0
SYMBOL res 1024 2200 R0
SYMATTR InstName Rtop
SYMATTR Value {Rtop}
FLAG 1040 2216 out
FLAG 1040 2296 fb
SYMBOL res 1120 2200 R0
SYMATTR InstName R3
SYMATTR Value {R3}
FLAG 1136 2216 out
FLAG 1136 2296 n3
SYMBOL cap 1120 2344 R0
SYMATTR InstName C3
SYMATTR Value {C3}
FLAG 1136 2344 n3
FLAG 1136 2408 fb
SYMBOL res 1216 2200 R0
SYMATTR InstName Rbot
SYMATTR Value {Rbot}
FLAG 1232 2216 fb
FLAG 1232 2296 0
SYMBOL res 1312 2200 R0
SYMATTR InstName R2
SYMATTR Value {R2}
FLAG 1328 2216 fb
FLAG 1328 2296 n2
SYMBOL cap 1312 2344 R0
SYMATTR InstName C1
SYMATTR Value {C1}
FLAG 1328 2344 n2
FLAG 1328 2408 comp
SYMBOL cap 1408 2200 R0
SYMATTR InstName C2
SYMATTR Value {C2}
FLAG 1424 2200 fb
FLAG 1424 2264 comp
SYMBOL voltage 1504 2200 R0
SYMATTR InstName Vref
SYMATTR Value PWL(0 0 {Tss0} 0 {Tss0+Tss} {Vref})
FLAG 1504 2216 ref
FLAG 1504 2296 0
SYMBOL bi 1600 2200 R0
SYMATTR InstName B_GM
SYMATTR Value I={gm}*(V(ref)-V(fb))
FLAG 1600 2200 0
FLAG 1600 2280 ea
SYMBOL res 1696 2200 R0
SYMATTR InstName Rea
SYMATTR Value {A0/gm}
FLAG 1712 2216 ea
FLAG 1712 2296 0
SYMBOL cap 1792 2200 R0
SYMATTR InstName Cea
SYMATTR Value {gm/(2*pi*GBW)}
FLAG 1808 2200 ea
FLAG 1808 2264 0
SYMBOL bv 1888 2200 R0
SYMATTR InstName B_EAOUT
SYMATTR Value V=limit(V(ea),0.02,4)
FLAG 1888 2216 comp
FLAG 1888 2296 0
SYMBOL bv 2048 2200 R0
SYMATTR InstName B_ENID
SYMATTR Value V=(1+tanh((time-50u)/10u))/2
FLAG 2048 2216 enid
FLAG 2048 2296 0
SYMBOL bv 2144 2200 R0
SYMATTR InstName B_ENESC
SYMATTR Value V=(1+tanh((time-0.5m)/0.1m))/2
FLAG 2144 2216 enesc
FLAG 2144 2296 0
SYMBOL bv 2240 2200 R0
SYMATTR InstName B_ENMOD
SYMATTR Value V=(1+tanh((time-0.4m)/0.1m))/2
FLAG 2240 2216 enmod
FLAG 2240 2296 0
TEXT 32 -720 Left 2 ; === 08  REDUNDANT AVIONICS POWER: one 5 V rail from three floating packs, without ground loops or back-feed ===
TEXT 32 -688 Left 2 !.param Vb1=15.2 Vb2=15.0 Vb3=14.8 Rbatt=0.02
TEXT 32 -656 Left 2 !.param Rh1=0.002656 Lh1=4.665e-08 Rh2=0.005968 Lh2=1.399e-07 Rh3=0.010936 Lh3=7.695e-07   ; harness loops (04)
TEXT 32 -624 Left 2 !.param Ccer=10u Cbulk=470u Rsig=0.027 Lsig=2e-07 Fvf=3k   ; Fvf: ESC bus-measurement bandwidth (04)
TEXT 32 -592 Left 2 !.param Pesc1=42.35 Pesc2=125.9 Pesc3=15.39 P1p=365.0 Tp=3m Tunp=5m Tsh=6m   ; ESC loads (04 operating points), events
TEXT 32 -560 Left 2 !.param Rtap=0.004143 Ltap=4.757e-08 Rret=0.004143 Lret=4.757e-08   ; 15 cm 18 AWG pairs to the power board
TEXT 32 -528 Left 2 !.param Vreg=0.02 Vrev=-0.011 Ichg=0.0027 Ipd=2.4 Vlin=0.05 Tsense=3e-07   ; ideal-diode controller (LM74700-style)
TEXT 32 -496 Left 2 !.param Lout=6.8e-06 DCR=0.015 Cout=3.96e-05 ESR=0.001667 Cin=1e-05 KFF=10.0 Dmax=0.9 Fff=100k Pfet=0.33 Iload=3.0
TEXT 32 -464 Left 2 !.param Vref=0.8 Rtop=5.23e+04 Rbot=1e+04 R2=1.87e+04 C1=1.8e-09 C2=3.3e-11 R3=1430 C3=4.7e-10 gm=1m A0=10k GBW=10Meg Tss0=0.1m Tss=0.5m
TEXT 32 -432 Left 2 !.param Vset1=5.025 Vset2=5.0 Vset3=4.975 Rdroop=0.05 Leq=1e-06 Cmo=4.7e-05 ESRmo=0.02 Eta=0.85   ; isolated modules
TEXT 32 -400 Left 2 !.step param Case list 0 1 2 3 4   ; 0 +OR only | 1 +/- OR | 2 +OR + star return | 3 Schottky + star | 4 isolated DC-DC per pack
TEXT 32 -368 Left 2 !.param OnP={if(Case<=2,1,0)} OnN={if(Case==1,1,0)} Iso={if(Case==4,1,0)}
TEXT 32 -336 Left 2 !.model ORFET VDMOS(Rd=0.001 Rs=0.0005 Vto=2.0 Kp=100.0 Cgdmax=1n Cgdmin=150p Cgs=2.5e-09 Cjo=1n Is=10p N=1.05 Rb=3m BV=40.0 IBV=1m Vds=40 Ron=2.7m Qg=30n mfg=Learning)
TEXT 32 -304 Left 2 !.model SCH D(Is=5e-06 N=1.05 Rs=0.03 Cjo=3e-10 BV=40.0 IBV=100u)
TEXT 32 -272 Left 2 !.model SWU SW(Ron=10u Roff=100Meg Vt=0.5 Vh=-0.4)
TEXT 32 -240 Left 2 !.model SWSH SW(Ron=5m Roff=100Meg Vt=0.5 Vh=-0.4)
TEXT 32 -208 Left 2 !.tran 0 7m 0
TEXT 32 -176 Left 2 !.options method=gear   ; trapezoidal stalls in the ~20 MHz ring after diode 2 avalanches (1.1 GB, no finish); Gear damps real ringing a little
TEXT 32 2560 Left 2 !.save V(vin) V(out) V(d) V(bus1) V(bus2) V(bus3) V(g1) V(g2) V(g3) V(a1) V(a2) V(a3) I(Ltp1) I(Ltp2) I(Ltp3) I(Lsig1) I(Lsig2) I(Lsig3) I(Lrt1) I(Lrt2) I(Lrt3) I(Lpos1) I(Lpos2) I(Lpos3) V(gP1) V(gP2) V(gP3) I(Leq1) I(Leq2) I(Leq3) V(mo1) V(mo2) V(mo3) V(r1)
TEXT 32 2586 Left 2 !.meas TRAN Itap1_n AVG I(Ltp1) FROM 2.4m TO 2.9m
TEXT 32 2612 Left 2 !.meas TRAN Isig1_n AVG -I(Lsig1) FROM 2.4m TO 2.9m
TEXT 32 2638 Left 2 !.meas TRAN Iret1_n AVG I(Lrt1) FROM 2.4m TO 2.9m
TEXT 32 2664 Left 2 !.meas TRAN Imod1_n AVG I(Leq1) FROM 2.4m TO 2.9m
TEXT 32 2690 Left 2 !.meas TRAN Vbus1_n AVG V(bus1,g1) FROM 2.4m TO 2.9m
TEXT 32 2716 Left 2 !.meas TRAN Itap2_n AVG I(Ltp2) FROM 2.4m TO 2.9m
TEXT 32 2742 Left 2 !.meas TRAN Isig2_n AVG -I(Lsig2) FROM 2.4m TO 2.9m
TEXT 32 2768 Left 2 !.meas TRAN Iret2_n AVG I(Lrt2) FROM 2.4m TO 2.9m
TEXT 32 2794 Left 2 !.meas TRAN Imod2_n AVG I(Leq2) FROM 2.4m TO 2.9m
TEXT 32 2820 Left 2 !.meas TRAN Vbus2_n AVG V(bus2,g2) FROM 2.4m TO 2.9m
TEXT 32 2846 Left 2 !.meas TRAN Itap3_n AVG I(Ltp3) FROM 2.4m TO 2.9m
TEXT 32 2872 Left 2 !.meas TRAN Isig3_n AVG -I(Lsig3) FROM 2.4m TO 2.9m
TEXT 32 2898 Left 2 !.meas TRAN Iret3_n AVG I(Lrt3) FROM 2.4m TO 2.9m
TEXT 32 2924 Left 2 !.meas TRAN Imod3_n AVG I(Leq3) FROM 2.4m TO 2.9m
TEXT 32 2950 Left 2 !.meas TRAN Vbus3_n AVG V(bus3,g3) FROM 2.4m TO 2.9m
TEXT 32 2976 Left 2 !.meas TRAN Vin_n AVG V(vin) FROM 2.4m TO 2.9m
TEXT 32 3002 Left 2 !.meas TRAN Vout_n AVG V(out) FROM 2.4m TO 2.9m
TEXT 32 3028 Left 2 !.meas TRAN Pav_n AVG V(bus1,g1)*I(Ltp1)+V(bus2,g2)*I(Ltp2)+V(bus3,g3)*I(Ltp3) FROM 2.4m TO 2.9m
TEXT 32 3054 Left 2 !.meas TRAN Pld_n AVG V(out)*{Iload}*limit(V(out)/4,0,1) FROM 2.4m TO 2.9m
TEXT 32 3080 Left 2 !.meas TRAN Itap1_p AVG I(Ltp1) FROM 3.5m TO 3.95m
TEXT 32 3106 Left 2 !.meas TRAN Isig1_p AVG -I(Lsig1) FROM 3.5m TO 3.95m
TEXT 32 3132 Left 2 !.meas TRAN Iret1_p AVG I(Lrt1) FROM 3.5m TO 3.95m
TEXT 32 3158 Left 2 !.meas TRAN Imod1_p AVG I(Leq1) FROM 3.5m TO 3.95m
TEXT 32 3184 Left 2 !.meas TRAN Vbus1_p AVG V(bus1,g1) FROM 3.5m TO 3.95m
TEXT 32 3210 Left 2 !.meas TRAN Itap2_p AVG I(Ltp2) FROM 3.5m TO 3.95m
TEXT 32 3236 Left 2 !.meas TRAN Isig2_p AVG -I(Lsig2) FROM 3.5m TO 3.95m
TEXT 32 3262 Left 2 !.meas TRAN Iret2_p AVG I(Lrt2) FROM 3.5m TO 3.95m
TEXT 32 3288 Left 2 !.meas TRAN Imod2_p AVG I(Leq2) FROM 3.5m TO 3.95m
TEXT 32 3314 Left 2 !.meas TRAN Vbus2_p AVG V(bus2,g2) FROM 3.5m TO 3.95m
TEXT 32 3340 Left 2 !.meas TRAN Itap3_p AVG I(Ltp3) FROM 3.5m TO 3.95m
TEXT 32 3366 Left 2 !.meas TRAN Isig3_p AVG -I(Lsig3) FROM 3.5m TO 3.95m
TEXT 32 3392 Left 2 !.meas TRAN Iret3_p AVG I(Lrt3) FROM 3.5m TO 3.95m
TEXT 32 3418 Left 2 !.meas TRAN Imod3_p AVG I(Leq3) FROM 3.5m TO 3.95m
TEXT 32 3444 Left 2 !.meas TRAN Vbus3_p AVG V(bus3,g3) FROM 3.5m TO 3.95m
TEXT 32 3470 Left 2 !.meas TRAN Vin_p AVG V(vin) FROM 3.5m TO 3.95m
TEXT 32 3496 Left 2 !.meas TRAN Vout_p AVG V(out) FROM 3.5m TO 3.95m
TEXT 32 3522 Left 2 !.meas TRAN Pav_p AVG V(bus1,g1)*I(Ltp1)+V(bus2,g2)*I(Ltp2)+V(bus3,g3)*I(Ltp3) FROM 3.5m TO 3.95m
TEXT 32 3548 Left 2 !.meas TRAN Pld_p AVG V(out)*{Iload}*limit(V(out)/4,0,1) FROM 3.5m TO 3.95m
TEXT 32 3574 Left 2 !.meas TRAN Itap1_a AVG I(Ltp1) FROM 6.6m TO 6.95m
TEXT 32 3600 Left 2 !.meas TRAN Isig1_a AVG -I(Lsig1) FROM 6.6m TO 6.95m
TEXT 32 3626 Left 2 !.meas TRAN Iret1_a AVG I(Lrt1) FROM 6.6m TO 6.95m
TEXT 32 3652 Left 2 !.meas TRAN Imod1_a AVG I(Leq1) FROM 6.6m TO 6.95m
TEXT 32 3678 Left 2 !.meas TRAN Vbus1_a AVG V(bus1,g1) FROM 6.6m TO 6.95m
TEXT 32 3704 Left 2 !.meas TRAN Itap2_a AVG I(Ltp2) FROM 6.6m TO 6.95m
TEXT 32 3730 Left 2 !.meas TRAN Isig2_a AVG -I(Lsig2) FROM 6.6m TO 6.95m
TEXT 32 3756 Left 2 !.meas TRAN Iret2_a AVG I(Lrt2) FROM 6.6m TO 6.95m
TEXT 32 3782 Left 2 !.meas TRAN Imod2_a AVG I(Leq2) FROM 6.6m TO 6.95m
TEXT 32 3808 Left 2 !.meas TRAN Vbus2_a AVG V(bus2,g2) FROM 6.6m TO 6.95m
TEXT 32 3834 Left 2 !.meas TRAN Itap3_a AVG I(Ltp3) FROM 6.6m TO 6.95m
TEXT 32 3860 Left 2 !.meas TRAN Isig3_a AVG -I(Lsig3) FROM 6.6m TO 6.95m
TEXT 32 3886 Left 2 !.meas TRAN Iret3_a AVG I(Lrt3) FROM 6.6m TO 6.95m
TEXT 32 3912 Left 2 !.meas TRAN Imod3_a AVG I(Leq3) FROM 6.6m TO 6.95m
TEXT 32 3938 Left 2 !.meas TRAN Vbus3_a AVG V(bus3,g3) FROM 6.6m TO 6.95m
TEXT 32 3964 Left 2 !.meas TRAN Vin_a AVG V(vin) FROM 6.6m TO 6.95m
TEXT 32 3990 Left 2 !.meas TRAN Vout_a AVG V(out) FROM 6.6m TO 6.95m
TEXT 32 4016 Left 2 !.meas TRAN Pav_a AVG V(bus1,g1)*I(Ltp1)+V(bus2,g2)*I(Ltp2)+V(bus3,g3)*I(Ltp3) FROM 6.6m TO 6.95m
TEXT 32 4042 Left 2 !.meas TRAN Pld_a AVG V(out)*{Iload}*limit(V(out)/4,0,1) FROM 6.6m TO 6.95m
TEXT 32 4068 Left 2 !.meas TRAN Vak1_n AVG V(a1)-V(vin) FROM 2.4m TO 2.9m
TEXT 32 4094 Left 2 !.meas TRAN Pd1_n AVG (V(a1)-V(vin))*I(Ltp1) FROM 2.4m TO 2.9m
TEXT 32 4120 Left 2 !.meas TRAN Vakn1_n AVG -V(r1) FROM 2.4m TO 2.9m
TEXT 32 4146 Left 2 !.meas TRAN t_hand WHEN I(Ltp2)+I(Ltp3)=0.52 TD=5m RISE=1
TEXT 32 4172 Left 2 !.meas TRAN Itap1_rev MIN I(Ltp1) FROM 5.1m TO 5.95m
TEXT 32 4198 Left 2 !.meas TRAN Vbus1_end AVG V(bus1,g1) FROM 5.9m TO 5.95m
TEXT 32 4224 Left 2 !.meas TRAN Vin_unp_min MIN V(vin) FROM 5m TO 5.95m
TEXT 32 4250 Left 2 !.meas TRAN Vout_unp_min MIN V(out) FROM 5m TO 5.95m
TEXT 32 4276 Left 2 !.meas TRAN Irev2_pk MIN I(Ltp2) FROM 6m TO 6.05m
TEXT 32 4302 Left 2 !.meas TRAN Isig2_sh MAX I(Lsig2) FROM 6m TO 6.05m
TEXT 32 4328 Left 2 !.meas TRAN t_off WHEN V(gP2)-V(a2)=1 TD=6m FALL=1
TEXT 32 4354 Left 2 !.meas TRAN Vds2_pk MAX V(vin)-V(a2) FROM 6m TO 6.05m
TEXT 32 4380 Left 2 !.meas TRAN Vin_sh_min MIN V(vin) FROM 6m TO 6.1m
TEXT 32 4406 Left 2 !.meas TRAN Vout_sh_min MIN V(out) FROM 6m TO 6.6m
TEXT 32 4432 Left 2 !.meas TRAN Vout_sh_max MAX V(out) FROM 6m TO 6.6m
TEXT 32 4458 Left 2 !.meas TRAN Itap2_after AVG I(Ltp2) FROM 6.6m TO 6.95m
TEXT 32 4484 Left 2 !.meas TRAN Vout_min_all MIN V(out) FROM 1.5m TO 7m
TEXT 32 4510 Left 2 !.meas TRAN Vout_max_all MAX V(out) FROM 1.5m TO 7m

The netlist it stands for:
* Redundant_Avionics.asc
Vbat1 bp01 bn1 {Vb1}
Rint1 bp01 bpi1 {Rbatt}
S_UNP bpi1 bp1 cunp 0 SWU
Vcunp cunp 0 PWL(0 1 {Tunp} 1 {Tunp+20u} 0)
Lpos1 bp1 bus1 {Lh1/2} Rser={Rh1/2}
Lneg1 g1 bn1 {Lh1/2} Rser={Rh1/2}
Ccer1 bus1 g1 {Ccer} Rser=2m Lser=2n
Cbulk1 bus1 g1 {Cbulk} Rser=30m Lser=10n
B_ESC1 bus1 g1 I=V(p1)/max(V(vbf1),6)*V(enesc)*(1+tanh((V(vbf1)-9)/0.3))/2
B_VB1 vbs1 0 V=V(bus1,g1)
Rvf1 vbs1 vbf1 1k
Cvf1 vbf1 0 {1/(2*pi*1k*Fvf)}
Vp1 p1 0 PWL(0 {Pesc1} {Tp} {Pesc1} {Tp+100u} {P1p} {Tp+1m} {P1p} {Tp+1.1m} {Pesc1})
Lsig1 g1 0 {Lsig} Rser={Rsig}
Ltp1 bus1 a1 {Ltap} Rser={Rtap}
MP1 vin gP1 a1 a1 ORFET
RgsP1 gP1 a1 10Meg
B_SENP1 srP1 0 V=V(a1)-V(vin)
RsnP1 srP1 sP1 1k
CsnP1 sP1 0 {Tsense/1k}
B_GP1 a1 gP1 I={Ichg}*V(enid)*{OnP}*(max(limit((V(sP1)-{Vreg})/{Vlin},-1,1),0)*(1-tanh((V(gP1,a1)-11)/0.3))/2+min(limit((V(sP1)-{Vreg})/{Vlin},-1,1),0)*(1+tanh((V(gP1,a1)-0.3)/0.05))/2)-{Ipd}*{OnP}*(1-tanh((V(sP1)-{Vrev})/1m))/2*(1+tanh((V(gP1,a1)-0.3)/0.05))/2
Rsch1 a1 as1 {if(Case==3,1u,1G)}
DS1 as1 vin SCH
MN1 r1 gN1 0 0 ORFET
RgsN1 gN1 0 10Meg
B_SENN1 srN1 0 V=V(0)-V(r1)
RsnN1 srN1 sN1 1k
CsnN1 sN1 0 {Tsense/1k}
B_GN1 0 gN1 I={Ichg}*V(enid)*{OnN}*(max(limit((V(sN1)-{Vreg})/{Vlin},-1,1),0)*(1-tanh((V(gN1,0)-11)/0.3))/2+min(limit((V(sN1)-{Vreg})/{Vlin},-1,1),0)*(1+tanh((V(gN1,0)-0.3)/0.05))/2)-{Ipd}*{OnN}*(1-tanh((V(sN1)-{Vrev})/1m))/2*(1+tanh((V(gN1,0)-0.3)/0.05))/2
Rbyp1 0 r1 {if(Case==1,1G,1u)}
Lrt1 r1 rr1 {Lret} Rser={Rret}
Rrsel1 rr1 g1 {if(Case>=1&Case<=3,1u,1G)}
Lmi1 g1 mi1 {Lret} Rser={Rret}
Rmsel1 mi1 mn1 {if(Iso,1u,1Meg)}
Cmi1 a1 mn1 10u Rser=5m
B_MI1 a1 mn1 I={Iso}*V(mo1)*I(Leq1)/{Eta}/max(V(mvf1),6)
B_MV1 mvs1 0 V=V(a1,mn1)
Rmv1 mvs1 mvf1 1k
Cmv1 mvf1 0 {1/(2*pi*1k*50k)}
B_EM1 em1 0 V={Iso}*V(enmod)*(1+tanh((V(mvf1)-9)/0.3))/2
B_VS1 vs1 0 V={Vset1}*V(em1)
Leq1 vs1 mo1 {Leq} Rser={Rdroop}
Cmo1 mo1 0 {Cmo} Rser={ESRmo}
MO1 out gO1 mo1 mo1 ORFET
RgsO1 gO1 mo1 10Meg
B_SENO1 srO1 0 V=V(mo1)-V(out)
RsnO1 srO1 sO1 1k
CsnO1 sO1 0 {Tsense/1k}
B_GO1 mo1 gO1 I={Ichg}*V(enid)*{Iso}*(max(limit((V(sO1)-{Vreg})/{Vlin},-1,1),0)*(1-tanh((V(gO1,mo1)-11)/0.3))/2+min(limit((V(sO1)-{Vreg})/{Vlin},-1,1),0)*(1+tanh((V(gO1,mo1)-0.3)/0.05))/2)-{Ipd}*{Iso}*(1-tanh((V(sO1)-{Vrev})/1m))/2*(1+tanh((V(gO1,mo1)-0.3)/0.05))/2
Vbat2 bp02 bn2 {Vb2}
Rint2 bp02 bp2 {Rbatt}
Lpos2 bp2 bus2 {Lh2/2} Rser={Rh2/2}
Lneg2 g2 bn2 {Lh2/2} Rser={Rh2/2}
Ccer2 bus2 g2 {Ccer} Rser=2m Lser=2n
Cbulk2 bus2 g2 {Cbulk} Rser=30m Lser=10n
B_ESC2 bus2 g2 I={Pesc2}/max(V(vbf2),6)*V(enesc)*(1+tanh((V(vbf2)-9)/0.3))/2
B_VB2 vbs2 0 V=V(bus2,g2)
Rvf2 vbs2 vbf2 1k
Cvf2 vbf2 0 {1/(2*pi*1k*Fvf)}
S_SH bus2 g2 csh 0 SWSH
Vcsh csh 0 PWL(0 0 {Tsh} 0 {Tsh+50n} 1)
Lsig2 g2 0 {Lsig} Rser={Rsig}
Ltp2 bus2 a2 {Ltap} Rser={Rtap}
MP2 vin gP2 a2 a2 ORFET
RgsP2 gP2 a2 10Meg
B_SENP2 srP2 0 V=V(a2)-V(vin)
RsnP2 srP2 sP2 1k
CsnP2 sP2 0 {Tsense/1k}
B_GP2 a2 gP2 I={Ichg}*V(enid)*{OnP}*(max(limit((V(sP2)-{Vreg})/{Vlin},-1,1),0)*(1-tanh((V(gP2,a2)-11)/0.3))/2+min(limit((V(sP2)-{Vreg})/{Vlin},-1,1),0)*(1+tanh((V(gP2,a2)-0.3)/0.05))/2)-{Ipd}*{OnP}*(1-tanh((V(sP2)-{Vrev})/1m))/2*(1+tanh((V(gP2,a2)-0.3)/0.05))/2
Rsch2 a2 as2 {if(Case==3,1u,1G)}
DS2 as2 vin SCH
MN2 r2 gN2 0 0 ORFET
RgsN2 gN2 0 10Meg
B_SENN2 srN2 0 V=V(0)-V(r2)
RsnN2 srN2 sN2 1k
CsnN2 sN2 0 {Tsense/1k}
B_GN2 0 gN2 I={Ichg}*V(enid)*{OnN}*(max(limit((V(sN2)-{Vreg})/{Vlin},-1,1),0)*(1-tanh((V(gN2,0)-11)/0.3))/2+min(limit((V(sN2)-{Vreg})/{Vlin},-1,1),0)*(1+tanh((V(gN2,0)-0.3)/0.05))/2)-{Ipd}*{OnN}*(1-tanh((V(sN2)-{Vrev})/1m))/2*(1+tanh((V(gN2,0)-0.3)/0.05))/2
Rbyp2 0 r2 {if(Case==1,1G,1u)}
Lrt2 r2 rr2 {Lret} Rser={Rret}
Rrsel2 rr2 g2 {if(Case>=1&Case<=3,1u,1G)}
Lmi2 g2 mi2 {Lret} Rser={Rret}
Rmsel2 mi2 mn2 {if(Iso,1u,1Meg)}
Cmi2 a2 mn2 10u Rser=5m
B_MI2 a2 mn2 I={Iso}*V(mo2)*I(Leq2)/{Eta}/max(V(mvf2),6)
B_MV2 mvs2 0 V=V(a2,mn2)
Rmv2 mvs2 mvf2 1k
Cmv2 mvf2 0 {1/(2*pi*1k*50k)}
B_EM2 em2 0 V={Iso}*V(enmod)*(1+tanh((V(mvf2)-9)/0.3))/2
B_VS2 vs2 0 V={Vset2}*V(em2)
Leq2 vs2 mo2 {Leq} Rser={Rdroop}
Cmo2 mo2 0 {Cmo} Rser={ESRmo}
MO2 out gO2 mo2 mo2 ORFET
RgsO2 gO2 mo2 10Meg
B_SENO2 srO2 0 V=V(mo2)-V(out)
RsnO2 srO2 sO2 1k
CsnO2 sO2 0 {Tsense/1k}
B_GO2 mo2 gO2 I={Ichg}*V(enid)*{Iso}*(max(limit((V(sO2)-{Vreg})/{Vlin},-1,1),0)*(1-tanh((V(gO2,mo2)-11)/0.3))/2+min(limit((V(sO2)-{Vreg})/{Vlin},-1,1),0)*(1+tanh((V(gO2,mo2)-0.3)/0.05))/2)-{Ipd}*{Iso}*(1-tanh((V(sO2)-{Vrev})/1m))/2*(1+tanh((V(gO2,mo2)-0.3)/0.05))/2
Vbat3 bp03 bn3 {Vb3}
Rint3 bp03 bp3 {Rbatt}
Lpos3 bp3 bus3 {Lh3/2} Rser={Rh3/2}
Lneg3 g3 bn3 {Lh3/2} Rser={Rh3/2}
Ccer3 bus3 g3 {Ccer} Rser=2m Lser=2n
Cbulk3 bus3 g3 {Cbulk} Rser=30m Lser=10n
B_ESC3 bus3 g3 I={Pesc3}/max(V(vbf3),6)*V(enesc)*(1+tanh((V(vbf3)-9)/0.3))/2
B_VB3 vbs3 0 V=V(bus3,g3)
Rvf3 vbs3 vbf3 1k
Cvf3 vbf3 0 {1/(2*pi*1k*Fvf)}
Lsig3 g3 0 {Lsig} Rser={Rsig}
Ltp3 bus3 a3 {Ltap} Rser={Rtap}
MP3 vin gP3 a3 a3 ORFET
RgsP3 gP3 a3 10Meg
B_SENP3 srP3 0 V=V(a3)-V(vin)
RsnP3 srP3 sP3 1k
CsnP3 sP3 0 {Tsense/1k}
B_GP3 a3 gP3 I={Ichg}*V(enid)*{OnP}*(max(limit((V(sP3)-{Vreg})/{Vlin},-1,1),0)*(1-tanh((V(gP3,a3)-11)/0.3))/2+min(limit((V(sP3)-{Vreg})/{Vlin},-1,1),0)*(1+tanh((V(gP3,a3)-0.3)/0.05))/2)-{Ipd}*{OnP}*(1-tanh((V(sP3)-{Vrev})/1m))/2*(1+tanh((V(gP3,a3)-0.3)/0.05))/2
Rsch3 a3 as3 {if(Case==3,1u,1G)}
DS3 as3 vin SCH
MN3 r3 gN3 0 0 ORFET
RgsN3 gN3 0 10Meg
B_SENN3 srN3 0 V=V(0)-V(r3)
RsnN3 srN3 sN3 1k
CsnN3 sN3 0 {Tsense/1k}
B_GN3 0 gN3 I={Ichg}*V(enid)*{OnN}*(max(limit((V(sN3)-{Vreg})/{Vlin},-1,1),0)*(1-tanh((V(gN3,0)-11)/0.3))/2+min(limit((V(sN3)-{Vreg})/{Vlin},-1,1),0)*(1+tanh((V(gN3,0)-0.3)/0.05))/2)-{Ipd}*{OnN}*(1-tanh((V(sN3)-{Vrev})/1m))/2*(1+tanh((V(gN3,0)-0.3)/0.05))/2
Rbyp3 0 r3 {if(Case==1,1G,1u)}
Lrt3 r3 rr3 {Lret} Rser={Rret}
Rrsel3 rr3 g3 {if(Case>=1&Case<=3,1u,1G)}
Lmi3 g3 mi3 {Lret} Rser={Rret}
Rmsel3 mi3 mn3 {if(Iso,1u,1Meg)}
Cmi3 a3 mn3 10u Rser=5m
B_MI3 a3 mn3 I={Iso}*V(mo3)*I(Leq3)/{Eta}/max(V(mvf3),6)
B_MV3 mvs3 0 V=V(a3,mn3)
Rmv3 mvs3 mvf3 1k
Cmv3 mvf3 0 {1/(2*pi*1k*50k)}
B_EM3 em3 0 V={Iso}*V(enmod)*(1+tanh((V(mvf3)-9)/0.3))/2
B_VS3 vs3 0 V={Vset3}*V(em3)
Leq3 vs3 mo3 {Leq} Rser={Rdroop}
Cmo3 mo3 0 {Cmo} Rser={ESRmo}
MO3 out gO3 mo3 mo3 ORFET
RgsO3 gO3 mo3 10Meg
B_SENO3 srO3 0 V=V(mo3)-V(out)
RsnO3 srO3 sO3 1k
CsnO3 sO3 0 {Tsense/1k}
B_GO3 mo3 gO3 I={Ichg}*V(enid)*{Iso}*(max(limit((V(sO3)-{Vreg})/{Vlin},-1,1),0)*(1-tanh((V(gO3,mo3)-11)/0.3))/2+min(limit((V(sO3)-{Vreg})/{Vlin},-1,1),0)*(1+tanh((V(gO3,mo3)-0.3)/0.05))/2)-{Ipd}*{Iso}*(1-tanh((V(sO3)-{Vrev})/1m))/2*(1+tanh((V(gO3,mo3)-0.3)/0.05))/2
Cin vin 0 {Cin} Rser=3m Lser=0.5n
B_IIN vin 0 I=(1-{Iso})*(V(d)*I(L1)+{Pfet}*limit(V(out)/4,0,1)/max(V(vin),5))
B_SW sw 0 V=V(d)*V(vin)
Rbsel sw swl {if(Iso,1G,1u)}
L1 swl out {Lout} Rser={DCR}
Cout out 0 {Cout} Rser={ESR} Lser=0.3n
B_LOAD out 0 I={Iload}*limit(V(out)/4,0,1)
Rff vin vinf 1k
Cff vinf 0 {1/(2*pi*1k*Fff)}
B_D d 0 V=limit(V(comp)/(max(V(vinf),1)/{KFF}),0,{Dmax})
Rtop out fb {Rtop}
R3 out n3 {R3}
C3 n3 fb {C3}
Rbot fb 0 {Rbot}
R2 fb n2 {R2}
C1 n2 comp {C1}
C2 fb comp {C2}
Vref ref 0 PWL(0 0 {Tss0} 0 {Tss0+Tss} {Vref})
B_GM 0 ea I={gm}*(V(ref)-V(fb))
Rea ea 0 {A0/gm}
Cea ea 0 {gm/(2*pi*GBW)}
B_EAOUT comp 0 V=limit(V(ea),0.02,4)
B_ENID enid 0 V=(1+tanh((time-50u)/10u))/2
B_ENESC enesc 0 V=(1+tanh((time-0.5m)/0.1m))/2
B_ENMOD enmod 0 V=(1+tanh((time-0.4m)/0.1m))/2
.model D D
.lib standard.dio
.model NMOS NMOS
.model PMOS PMOS
.lib standard.mos
*  CHANNEL 1: pack 1 (floating) -> harness 1 -> ESC 1 bus -> 18 AWG tap pair to the avionics power board
*  isolated module 1 (Case 4 only): input from tap 1, output OR'ed onto the 5 V rail
*  CHANNEL 2: pack 2 (floating) -> harness 2 -> ESC 2 bus -> 18 AWG tap pair to the avionics power board
*  isolated module 2 (Case 4 only): input from tap 2, output OR'ed onto the 5 V rail
*  CHANNEL 3: pack 3 (floating) -> harness 3 -> ESC 3 bus -> 18 AWG tap pair to the avionics power board
*  isolated module 3 (Case 4 only): input from tap 3, output OR'ed onto the 5 V rail
*  BEC (topology 06) AVERAGED: <v_sw> = d*Vin, <i_in> = d*iL + switching/conduction loss; Type III + filtered input feed-forward
*  === 08  REDUNDANT AVIONICS POWER: one 5 V rail from three floating packs, without ground loops or back-feed ===
.param Vb1=15.2 Vb2=15.0 Vb3=14.8 Rbatt=0.02
.param Rh1=0.002656 Lh1=4.665e-08 Rh2=0.005968 Lh2=1.399e-07 Rh3=0.010936 Lh3=7.695e-07   ; harness loops (04)
.param Ccer=10u Cbulk=470u Rsig=0.027 Lsig=2e-07 Fvf=3k   ; Fvf: ESC bus-measurement bandwidth (04)
.param Pesc1=42.35 Pesc2=125.9 Pesc3=15.39 P1p=365.0 Tp=3m Tunp=5m Tsh=6m   ; ESC loads (04 operating points), events
.param Rtap=0.004143 Ltap=4.757e-08 Rret=0.004143 Lret=4.757e-08   ; 15 cm 18 AWG pairs to the power board
.param Vreg=0.02 Vrev=-0.011 Ichg=0.0027 Ipd=2.4 Vlin=0.05 Tsense=3e-07   ; ideal-diode controller (LM74700-style)
.param Lout=6.8e-06 DCR=0.015 Cout=3.96e-05 ESR=0.001667 Cin=1e-05 KFF=10.0 Dmax=0.9 Fff=100k Pfet=0.33 Iload=3.0
.param Vref=0.8 Rtop=5.23e+04 Rbot=1e+04 R2=1.87e+04 C1=1.8e-09 C2=3.3e-11 R3=1430 C3=4.7e-10 gm=1m A0=10k GBW=10Meg Tss0=0.1m Tss=0.5m
.param Vset1=5.025 Vset2=5.0 Vset3=4.975 Rdroop=0.05 Leq=1e-06 Cmo=4.7e-05 ESRmo=0.02 Eta=0.85   ; isolated modules
.step param Case list 0 1 2 3 4   ; 0 +OR only | 1 +/- OR | 2 +OR + star return | 3 Schottky + star | 4 isolated DC-DC per pack
.param OnP={if(Case<=2,1,0)} OnN={if(Case==1,1,0)} Iso={if(Case==4,1,0)}
.model ORFET VDMOS(Rd=0.001 Rs=0.0005 Vto=2.0 Kp=100.0 Cgdmax=1n Cgdmin=150p Cgs=2.5e-09 Cjo=1n Is=10p N=1.05 Rb=3m BV=40.0 IBV=1m Vds=40 Ron=2.7m Qg=30n mfg=Learning)
.model SCH D(Is=5e-06 N=1.05 Rs=0.03 Cjo=3e-10 BV=40.0 IBV=100u)
.model SWU SW(Ron=10u Roff=100Meg Vt=0.5 Vh=-0.4)
.model SWSH SW(Ron=5m Roff=100Meg Vt=0.5 Vh=-0.4)
.tran 0 7m 0
.options method=gear   ; trapezoidal stalls in the ~20 MHz ring after diode 2 avalanches (1.1 GB, no finish); Gear damps real ringing a little
.save V(vin) V(out) V(d) V(bus1) V(bus2) V(bus3) V(g1) V(g2) V(g3) V(a1) V(a2) V(a3) I(Ltp1) I(Ltp2) I(Ltp3) I(Lsig1) I(Lsig2) I(Lsig3) I(Lrt1) I(Lrt2) I(Lrt3) I(Lpos1) I(Lpos2) I(Lpos3) V(gP1) V(gP2) V(gP3) I(Leq1) I(Leq2) I(Leq3) V(mo1) V(mo2) V(mo3) V(r1)
.meas TRAN Itap1_n AVG I(Ltp1) FROM 2.4m TO 2.9m
.meas TRAN Isig1_n AVG -I(Lsig1) FROM 2.4m TO 2.9m
.meas TRAN Iret1_n AVG I(Lrt1) FROM 2.4m TO 2.9m
.meas TRAN Imod1_n AVG I(Leq1) FROM 2.4m TO 2.9m
.meas TRAN Vbus1_n AVG V(bus1,g1) FROM 2.4m TO 2.9m
.meas TRAN Itap2_n AVG I(Ltp2) FROM 2.4m TO 2.9m
.meas TRAN Isig2_n AVG -I(Lsig2) FROM 2.4m TO 2.9m
.meas TRAN Iret2_n AVG I(Lrt2) FROM 2.4m TO 2.9m
.meas TRAN Imod2_n AVG I(Leq2) FROM 2.4m TO 2.9m
.meas TRAN Vbus2_n AVG V(bus2,g2) FROM 2.4m TO 2.9m
.meas TRAN Itap3_n AVG I(Ltp3) FROM 2.4m TO 2.9m
.meas TRAN Isig3_n AVG -I(Lsig3) FROM 2.4m TO 2.9m
.meas TRAN Iret3_n AVG I(Lrt3) FROM 2.4m TO 2.9m
.meas TRAN Imod3_n AVG I(Leq3) FROM 2.4m TO 2.9m
.meas TRAN Vbus3_n AVG V(bus3,g3) FROM 2.4m TO 2.9m
.meas TRAN Vin_n AVG V(vin) FROM 2.4m TO 2.9m
.meas TRAN Vout_n AVG V(out) FROM 2.4m TO 2.9m
.meas TRAN Pav_n AVG V(bus1,g1)*I(Ltp1)+V(bus2,g2)*I(Ltp2)+V(bus3,g3)*I(Ltp3) FROM 2.4m TO 2.9m
.meas TRAN Pld_n AVG V(out)*{Iload}*limit(V(out)/4,0,1) FROM 2.4m TO 2.9m
.meas TRAN Itap1_p AVG I(Ltp1) FROM 3.5m TO 3.95m
.meas TRAN Isig1_p AVG -I(Lsig1) FROM 3.5m TO 3.95m
.meas TRAN Iret1_p AVG I(Lrt1) FROM 3.5m TO 3.95m
.meas TRAN Imod1_p AVG I(Leq1) FROM 3.5m TO 3.95m
.meas TRAN Vbus1_p AVG V(bus1,g1) FROM 3.5m TO 3.95m
.meas TRAN Itap2_p AVG I(Ltp2) FROM 3.5m TO 3.95m
.meas TRAN Isig2_p AVG -I(Lsig2) FROM 3.5m TO 3.95m
.meas TRAN Iret2_p AVG I(Lrt2) FROM 3.5m TO 3.95m
.meas TRAN Imod2_p AVG I(Leq2) FROM 3.5m TO 3.95m
.meas TRAN Vbus2_p AVG V(bus2,g2) FROM 3.5m TO 3.95m
.meas TRAN Itap3_p AVG I(Ltp3) FROM 3.5m TO 3.95m
.meas TRAN Isig3_p AVG -I(Lsig3) FROM 3.5m TO 3.95m
.meas TRAN Iret3_p AVG I(Lrt3) FROM 3.5m TO 3.95m
.meas TRAN Imod3_p AVG I(Leq3) FROM 3.5m TO 3.95m
.meas TRAN Vbus3_p AVG V(bus3,g3) FROM 3.5m TO 3.95m
.meas TRAN Vin_p AVG V(vin) FROM 3.5m TO 3.95m
.meas TRAN Vout_p AVG V(out) FROM 3.5m TO 3.95m
.meas TRAN Pav_p AVG V(bus1,g1)*I(Ltp1)+V(bus2,g2)*I(Ltp2)+V(bus3,g3)*I(Ltp3) FROM 3.5m TO 3.95m
.meas TRAN Pld_p AVG V(out)*{Iload}*limit(V(out)/4,0,1) FROM 3.5m TO 3.95m
.meas TRAN Itap1_a AVG I(Ltp1) FROM 6.6m TO 6.95m
.meas TRAN Isig1_a AVG -I(Lsig1) FROM 6.6m TO 6.95m
.meas TRAN Iret1_a AVG I(Lrt1) FROM 6.6m TO 6.95m
.meas TRAN Imod1_a AVG I(Leq1) FROM 6.6m TO 6.95m
.meas TRAN Vbus1_a AVG V(bus1,g1) FROM 6.6m TO 6.95m
.meas TRAN Itap2_a AVG I(Ltp2) FROM 6.6m TO 6.95m
.meas TRAN Isig2_a AVG -I(Lsig2) FROM 6.6m TO 6.95m
.meas TRAN Iret2_a AVG I(Lrt2) FROM 6.6m TO 6.95m
.meas TRAN Imod2_a AVG I(Leq2) FROM 6.6m TO 6.95m
.meas TRAN Vbus2_a AVG V(bus2,g2) FROM 6.6m TO 6.95m
.meas TRAN Itap3_a AVG I(Ltp3) FROM 6.6m TO 6.95m
.meas TRAN Isig3_a AVG -I(Lsig3) FROM 6.6m TO 6.95m
.meas TRAN Iret3_a AVG I(Lrt3) FROM 6.6m TO 6.95m
.meas TRAN Imod3_a AVG I(Leq3) FROM 6.6m TO 6.95m
.meas TRAN Vbus3_a AVG V(bus3,g3) FROM 6.6m TO 6.95m
.meas TRAN Vin_a AVG V(vin) FROM 6.6m TO 6.95m
.meas TRAN Vout_a AVG V(out) FROM 6.6m TO 6.95m
.meas TRAN Pav_a AVG V(bus1,g1)*I(Ltp1)+V(bus2,g2)*I(Ltp2)+V(bus3,g3)*I(Ltp3) FROM 6.6m TO 6.95m
.meas TRAN Pld_a AVG V(out)*{Iload}*limit(V(out)/4,0,1) FROM 6.6m TO 6.95m
.meas TRAN Vak1_n AVG V(a1)-V(vin) FROM 2.4m TO 2.9m
.meas TRAN Pd1_n AVG (V(a1)-V(vin))*I(Ltp1) FROM 2.4m TO 2.9m
.meas TRAN Vakn1_n AVG -V(r1) FROM 2.4m TO 2.9m
.meas TRAN t_hand WHEN I(Ltp2)+I(Ltp3)=0.52 TD=5m RISE=1
.meas TRAN Itap1_rev MIN I(Ltp1) FROM 5.1m TO 5.95m
.meas TRAN Vbus1_end AVG V(bus1,g1) FROM 5.9m TO 5.95m
.meas TRAN Vin_unp_min MIN V(vin) FROM 5m TO 5.95m
.meas TRAN Vout_unp_min MIN V(out) FROM 5m TO 5.95m
.meas TRAN Irev2_pk MIN I(Ltp2) FROM 6m TO 6.05m
.meas TRAN Isig2_sh MAX I(Lsig2) FROM 6m TO 6.05m
.meas TRAN t_off WHEN V(gP2)-V(a2)=1 TD=6m FALL=1
.meas TRAN Vds2_pk MAX V(vin)-V(a2) FROM 6m TO 6.05m
.meas TRAN Vin_sh_min MIN V(vin) FROM 6m TO 6.1m
.meas TRAN Vout_sh_min MIN V(out) FROM 6m TO 6.6m
.meas TRAN Vout_sh_max MAX V(out) FROM 6m TO 6.6m
.meas TRAN Itap2_after AVG I(Ltp2) FROM 6.6m TO 6.95m
.meas TRAN Vout_min_all MIN V(out) FROM 1.5m TO 7m
.meas TRAN Vout_max_all MAX V(out) FROM 1.5m TO 7m
.backanno
.end